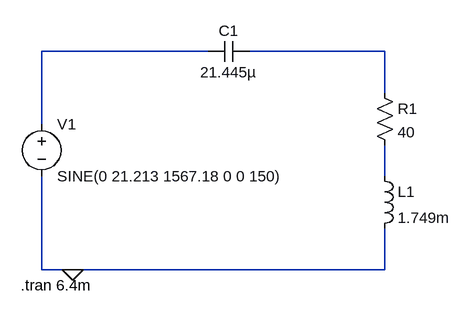
[diagram p0: schematic lab2task2.1.asc]
lab2task2.1.asc, the LTspice schematic file:
Version 4.1
SHEET 1 880 680
WIRE 48 16 -208 16
WIRE 320 16 112 16
WIRE 320 80 320 16
WIRE -208 128 -208 16
WIRE 320 208 320 160
WIRE -208 352 -208 208
WIRE -160 352 -208 352
WIRE 320 352 320 288
WIRE 320 352 -160 352
FLAG -160 352 0
SYMBOL res 304 64 R0
SYMATTR InstName R1
SYMATTR Value 40
SYMBOL voltage -208 112 R0
WINDOW 123 0 0 Left 0
WINDOW 39 0 0 Left 0
SYMATTR InstName V1
SYMATTR Value SINE(0 21.213 1567.18 0 0 150)
SYMBOL ind 304 192 R0
SYMATTR InstName L1
SYMATTR Value 1.749m
SYMATTR SpiceLine Rser=1m
SYMBOL cap 48 32 R270
WINDOW 0 32 32 VTop 2
WINDOW 3 0 32 VBottom 2
SYMATTR InstName C1
SYMATTR Value 21.445µ
TEXT -240 376 Left 2 !.tran 6.4m

The netlist it stands for:
* lab2task2.1.asc
R1 N002 N003 40
V1 N001 0 SINE(0 21.213 1567.18 0 0 150)
L1 N003 0 1.749m Rser=1m
C1 N001 N002 21.445µ
.tran 6.4m
.backanno
.end